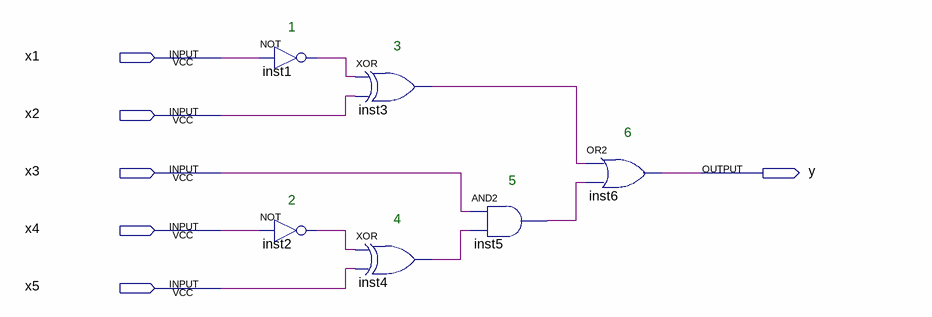
[diagram p0: schematic sheet]
// Quartus schematic no_basis.bdf as structural Verilog: 6 symbols, 6 pins
module no_basis (
  input  x1,
  input  x2,
  input  x3,
  input  x4,
  input  x5,
  output y
);

  wire inst1_out, inst2_out, inst3_out, inst4_out, inst5_out;

  not inst1 (inst1_out, x1);
  not inst2 (inst2_out, x4);
  xor inst3 (inst3_out, inst1_out, x2);
  xor inst4 (inst4_out, inst2_out, x5);
  and inst5 (inst5_out, x3, inst4_out);
  or inst6 (y, inst3_out, inst5_out);

  // Notes on the sheet:
  //   1
  //   3
  //   6
  //   5
  //   2
  //   4
endmodule
